# Altium project Light_SPT_Device_v1.0.PrjPcb (part 4 of 4)

## Sheet GPIOs_Relay_Rs232_Sheet.SchDoc
size 420 x 297 mm; SheetNumber: 5; SheetTotal: 5
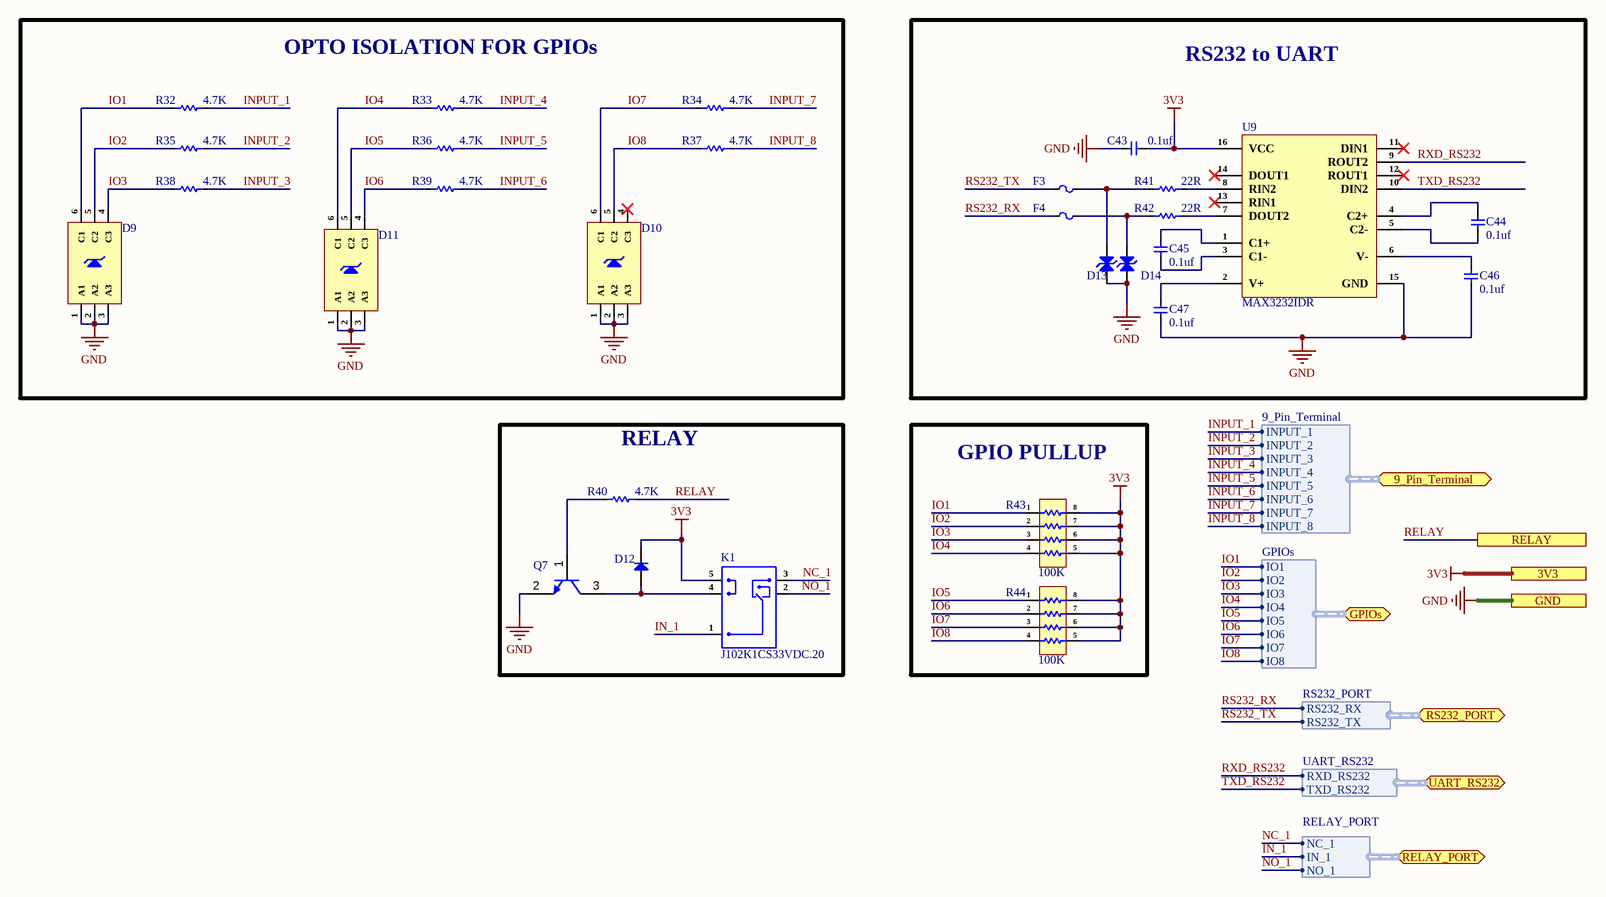
[diagram p4: GPIOs_Relay_Rs232_Sheet.SchDoc]

### Parts
C43  0.1uf  [Cap-0402]
C44  0.1uf  [Cap-0402]
C45  0.1uf  [Cap-0402]
C46  0.1uf  [Cap-0402]
C47  0.1uf  [Cap-0402]
D9  BZX84C3V3TS-7-F  [SOT-363]  (value not drawn)
D10  BZX84C3V3TS-7-F  [SOT-363]  (value not drawn)
D11  BZX84C3V3TS-7-F  [SOT-363]  (value not drawn)
D12  1N4148WS-7-F  [SOD-323]  (value not drawn)
D13  SMBJ26CA  [SMB_]  (value not drawn)
D14  SMBJ26CA  [SMB_]  (value not drawn)
F3  SMD0805P020TF  [Fuse-0805]  (value not drawn)
F4  SMD0805P020TF  [Fuse-0805]  (value not drawn)
K1  J102K1CS33VDC.20  [J102K1CS33VDC.20]
Q7  MMBT2222A-7-F  [SOT-23]  (value not drawn)
R32  4.7K  [Res-0402]
R33  4.7K  [Res-0402]
R34  4.7K  [Res-0402]
R35  4.7K  [Res-0402]
R36  4.7K  [Res-0402]
R37  4.7K  [Res-0402]
R38  4.7K  [Res-0402]
R39  4.7K  [Res-0402]
R40  4.7K  [Res-0402]
R41  22R  [Res-0402]
R42  22R  [Res-0402]
R43  100K  [YC164-JR-070RL]
R44  100K  [YC164-JR-070RL]
U9  MAX3232IDR  [SOIC-16]

### Blocks framed on the sheet
OPTO ISOLATION FOR GPIOs: D9-D11 R32-R39
RS232 to UART: C43-C47 D13 D14 F3 F4 R41 R42 U9
RELAY: D12 K1 Q7 R40
GPIO PULLUP: R43 R44

### Ports
3V3, 9_Pin_Terminal (bidir, harness 9_Pin_Terminal), GND, GPIOs (bidir, harness GPIOs), RELAY, RELAY_PORT (bidir, harness RELAY_PORT), RS232_PORT (bidir, harness RS232_PORT), UART_RS232 (bidir, harness UART_RS232)

### Harnesses
GPIOs: IO1, IO4, IO7, IO2, IO5, IO8, IO3, IO6
RELAY_PORT: NC_1, NO_1, IN_1
9_Pin_Terminal: INPUT_1, INPUT_2, INPUT_3, INPUT_4, INPUT_5, INPUT_6, INPUT_7, INPUT_8
RS232_PORT: RS232_RX, RS232_TX
UART_RS232: RXD_RS232, TXD_RS232

### Nets
3V3: C43.1 D12.1(K) K1.5 R43.5 R43.6 R43.7 R43.8 R44.5 R44.6 R44.7 R44.8 U9.16(VCC) ; port 3V3
GND: C43.2 C46.2 C47.2 D9.1(A1) D9.2(A2) D9.3(A3) D10.1(A1) D10.2(A2) D10.3(A3) D11.1(A1) D11.2(A2) D11.3(A3) D13.1(A) D14.1(A) Q7.2(E) U9.15(GND) ; port GND
IN_1: K1.1 ; port RELAY_PORT.IN_1
INPUT_1: R32.1 ; port 9_Pin_Terminal.INPUT_1
INPUT_2: R35.1 ; port 9_Pin_Terminal.INPUT_2
INPUT_3: R38.1 ; port 9_Pin_Terminal.INPUT_3
INPUT_4: R33.1 ; port 9_Pin_Terminal.INPUT_4
INPUT_5: R36.1 ; port 9_Pin_Terminal.INPUT_5
INPUT_6: R39.1 ; port 9_Pin_Terminal.INPUT_6
INPUT_7: R34.1 ; port 9_Pin_Terminal.INPUT_7
INPUT_8: R37.1 ; port 9_Pin_Terminal.INPUT_8
IO1: D9.6(C1) R32.2 R43.1 ; port GPIOs.IO1
IO2: D9.5(C2) R35.2 R43.2 ; port GPIOs.IO2
IO3: D9.4(C3) R38.2 R43.3 ; port GPIOs.IO3
IO4: D11.6(C1) R33.2 R43.4 ; port GPIOs.IO4
IO5: D11.5(C2) R36.2 R44.1 ; port GPIOs.IO5
IO6: D11.4(C3) R39.2 R44.2 ; port GPIOs.IO6
IO7: D10.6(C1) R34.2 R44.3 ; port GPIOs.IO7
IO8: D10.5(C2) R37.2 R44.4 ; port GPIOs.IO8
NC_1: K1.3 ; port RELAY_PORT.NC_1
NO_1: K1.2 ; port RELAY_PORT.NO_1
RELAY: R40.1 ; port RELAY
RS232_RX: F4.1 ; port RS232_PORT.RS232_RX
RS232_TX: F3.1 ; port RS232_PORT.RS232_TX
RXD_RS232: U9.9(ROUT2) ; port UART_RS232.RXD_RS232
TXD_RS232: U9.10(DIN2) ; port UART_RS232.TXD_RS232
NetC44_1: C44.1 U9.4(C2+)
NetC44_2: C44.2 U9.5(C2-)
NetC45_1: C45.1 U9.1(C1+)
NetC45_2: C45.2 U9.3(C1-)
NetC46_1: C46.1 U9.6(V-)
NetC47_1: C47.1 U9.2(V+)
NetD12_2: D12.2(A) K1.4 Q7.3(C)
NetD13_2: D13.2(K) F3.2 R41.1
NetD14_2: D14.2(K) F4.2 R42.1
NetQ7_1: Q7.1(B) R40.2
NetR41_2: R41.2 U9.8(RIN2)
NetR42_2: R42.2 U9.7(DOUT2)

Not connected (* = marked no-connect by the designer): D10 4(C3)*; U9 11(DIN1)* 12(ROUT1)* 13(RIN1)* 14(DOUT1)*

### Notes on the sheet
- File:
- Title:
- Date:
- Page
- Num:
- Total:
- Drawn By: Huzaifa Ali

### Library data of the parts
C43-C47 = GRM155R62A104KE14D: CAP CER 0.1UF 100V X5R 0402; Manufacturer: Murata; Capacitance: 100nF; Tolerance: 10%; Item Type: Capacitor; Supplier 1: Arrow Electronics; Manufacturer Part Number: GRM155R62A104KE14D; RoHS: Yes; Category: Ceramic Capacitors; Stock 1: 870000; Pricing 1: 10000=0.00500, 20000=0.00410, 30000=0.00390, 50000=0.00370, 100000=0.00300 (USD); Mount: Surface Mount; Case/Package: 0402; Case Code (Metric): 1005; Case Code (Imperial): 0402; Weight: 0.000212oz; Min Operating Temperature: -55°C; Max Operating Temperature: 85°C; Packaging: Tape and Reel; Voltage Rating: 100V; Dielectric: X5R; Termination: SMD/SMT; Voltage Rating (DC): 100V; Package Quantity: 10000; Series: GRM; Length: 0.039inch; Width: 0.02inch; Height: 0.5mm; Thickness: 0.022inch; Reach SVHC Compliant: Yes; Lead Free: Lead Free; RoHS Compliant: Yes; ComponentLink1URL: http://www.farnell.com/datasheets/2079151.pdf?src-supplier=Farnell; ComponentLink1Description: http://www.farnell.com/datasheets/2079151.pdf?src-supplier=Farnell; ComponentLink2URL: http://www.mouser.com/ds/2/281/c02e-2905.pdf?src-supplier=Mouser; ComponentLink2Description: http://www.mouser.com/ds/2/281/c02e-2905.pdf?src-supplier=Mouser; ComponentLink3URL: http://www.farnell.com/datasheets/2079151.pdf?src-supplier=Element14; ComponentLink3Description: http://www.farnell.com/datasheets/2079151.pdf?src-supplier=Element14; ComponentLink4URL: http://search.murata.co.jp/Ceramy/image/img/A01X/G101/ENG/GRM155R62A104KE14-01.pdf?src-supplier=Digi-Key; ComponentLink4Description: http://search.murata.co.jp/Ceramy/image/img/A01X/G101/ENG/GRM155R62A104KE14-01.pdf?src-supplier=Digi-Key; ComponentLink5URL: http://www.farnell.com/datasheets/2079151.pdf?src-supplier=Newark; ComponentLink5Description: http://www.farnell.com/datasheets/2079151.pdf?src-supplier=Newark; Supplier Part Number 1: GRM155R62A104KE14D; LCSC Part Number: C162178
D9-D11 = BZX84C3V3TS-7-F: DIODE ZENER ARRAY 3.3V SOT363; Manufacturer: Diodes Incorporated; Manufacturer Part Number: BZX84C3V3TS-7-F; Package: SOT-363-6; LCSC Part Number: C5124989; Item Type: Diode; ComponentLink1Description: LCSC; ComponentLink1URL: https://www.lcsc.com/product-detail/Zener-Diodes_Diodes-Incorporated-BZX84C3V3TS-7-F_C5124989.html
D12 = 1N4148WS-7-F: DIODE GEN PURP 75V 150MA SOD323; Manufacturer: Diodes; Forward Current: 300mA; Reverse Recovery Time: 4ns; Element Configuration: Single; Forward Voltage: 1.25V; Max Reverse Current: 1uA; Peak Non-Repetitive Surge Current: 2A; Power Dissipation: 200mW; Polarity: Standard; Capacitance: 2pF; Supplier 1: Mouser; Manufacturer Part Number: 1N4148WS-7-F; RoHS: Yes; Category: Rectifier Diodes; Pricing 1: 1=0.19000, 10=0.17500, 50=0.17500, 100=0.09600, 500=0.05900, 1000=0.04000, 3000=0.03000, 9000=0.02600, 10000=0.02600, 24000=0.02300, 45000=0.01900 (USD); Mount: Surface Mount; Number of Pins: 2; Weight: 0.000173oz; Contact Plating: Tin,Matte; Min Operating Temperature: -65°C; Max Operating Temperature: 150°C; Max Repetitive Reverse Voltage (Vrrm): 75V; Max Forward Surge Current (Ifsm): 2A; Max Surge Current: 2A; Packaging: Tape and Reel; Recovery Time: 4ns; Package Quantity: 3000; Average Rectified Current: 150mA; Voltage Rating (DC): 75V; Power Rating: 200mW; Current Rating: 150mA; Output Current: 150mA; Voltage: 75V; Max Reverse Voltage (DC): 75V; Series: -; Reverse Recovery Time-Max: 4ns; Length: 1.8mm; Width: 1.4mm; Height: 1mm; Radiation Hardening: No; REACH SVHC: No SVHC; Lead Free: Lead Free; RoHS Compliant: Yes; ComponentLink1URL: https://datasheet.ciiva.com/1179/ds30097-1179355.pdf?src-supplier=Element14; ComponentLink1Description: https://datasheet.ciiva.com/1179/ds30097-1179355.pdf?src-supplier=Element14; ComponentLink2URL: https://datasheet.ciiva.com/8300/ds30097-8300396.pdf?src-supplier=Avnet; ComponentLink2Description: https://datasheet.ciiva.com/8300/ds30097-8300396.pdf?src-supplier=Avnet; ComponentLink3URL: https://datasheet.ciiva.com/16199/ds30097-16199061.pdf?src-supplier=Future+Electronics; ComponentLink3Description: https://datasheet.ciiva.com/16199/ds30097-16199061.pdf?src-supplier=Future+Electronics; ComponentLink4URL: https://datasheet.ciiva.com/911/ds30097-911742.pdf?src-supplier=Digi-Key; ComponentLink4Description: https://datasheet.ciiva.com/911/ds30097-911742.pdf?src-supplier=Digi-Key; ComponentLink5URL: https://datasheet.ciiva.com/911/ds30097-911743.pdf?src-supplier=Digi-Key; ComponentLink5Description: https://datasheet.ciiva.com/911/ds30097-911743.pdf?src-supplier=Digi-Key; ComponentLink6URL: https://datasheet.ciiva.com/911/ds30097-911741.pdf?src-supplier=Digi-Key; ComponentLink6Description: https://datasheet.ciiva.com/911/ds30097-911741.pdf?src-supplier=Digi-Key; Supplier Part Number 1: 621-1N4148WS-F; LCSC Part Number: C60580; Item Type: Diode
D13 D14 = SMBJ26CA: SMB(DO-214AA) TVS ROHS; Manufacturer: MSKSEMI; Item Type: Diode; Manufacturer Part Number: SMBJ26CA; Package: SMB(DO-214AA); LCSC Part Number: C5331111; ComponentLink1Description: LCSC; ComponentLink1URL: https://www.lcsc.com/product-detail/TVS_MSKSEMI-SMBJ26CA_C5331111.html
F3 F4 = SMD0805P020TF: 9V 200mA 100A 500mA 0805 Resettable Fuses ROHS; Manufacturer: RUILON; Item Type: Fuse; Manufacturer Part Number: SMD0805P020TF; Package: 0805; LCSC Part Number: C20976; ComponentLink1Description: LCSC; ComponentLink1URL: https://www.lcsc.com/product-detail/Resettable-Fuses_RUILON-Shenzhen-Ruilongyuan-Elec-SMD0805P020TF_C20976.html
K1 = J102K1CS33VDC.20: RELAY GEN PURPOSE SPDT 3A 3V; Manufacturer: CIT Relay & Switch; Supplier: Digi-Key; Supplier Part Number: 2449-J102K1CS33VDC.20-ND; Manufacturer Part Number: J102K1CS33VDC.20; RoHS: No; Category: Power Relays; Stock: 9880; Pricing: 1=1.6, 10=1.5, 25=1.3332, 50=1.2666, 100=1.1999, 250=1.06656, 500=0.9999, 1000=0.93324, 5000=0.89991 (USD); Item Type: Relay
Q7 = MMBT2222A-7-F: TRANS NPN 40V 0.6A SMD SOT23-3; Manufacturer: Diodes; Max Power Dissipation: 300mW; Collector Base Voltage (VCBO): 75V; Max Collector Current: 600mA; hFE Min: 100; Frequency: 300MHz; Number of Elements: 1; Emitter Base Voltage (VEBO): 6V; Collector Emitter Saturation Voltage: 1V; Power Dissipation: 350mW; Element Configuration: Single; Current: 1A; Item Type: Mosfet; Supplier 1: Digi-Key; Manufacturer Part Number: MMBT2222A-7-F; Stock 1: 2471182; Pricing 1: 1=0.15, 10=0.134, 100=0.0729, 500=0.04486, 1000=0.03059 (USD); Mount: Surface Mount; Case/Package: SOT-23; Number of Pins: 3; Weight: 0.000282oz; Contact Plating: Matte,Tin; Min Operating Temperature: -55°C; Max Operating Temperature: 150°C; Packaging: Tape and Reel; Collector Emitter Voltage (VCEO): 40V; Polarity: NPN; Voltage Rating (DC): 40V; Package Quantity: 3000; Continuous Collector Current: 600mA; Collector Emitter Breakdown Voltage: 40V; Transition Frequency: 300MHz; Max Breakdown Voltage: 40V; Max Frequency: 300MHz; Termination: SMD/SMT; Gain Bandwidth Product: 300MHz; Current Rating: 600mA; Voltage: 40V; Length: 3.05mm; Height: 1mm; Width: 1.4mm; Radiation Hardening: No; Lead Free: Lead Free; REACH SVHC: No SVHC; ComponentLink1URL: http://www.diodes.com/datasheets/ds30041.pdf?src-supplier=Future+Electronics; ComponentLink1Description: http://www.diodes.com/datasheets/ds30041.pdf?src-supplier=Future+Electronics; ComponentLink2URL: http://www.diodes.com/datasheets/ds30041.pdf?src-supplier=Avnet; ComponentLink2Description: http://www.diodes.com/datasheets/ds30041.pdf?src-supplier=Avnet; ComponentLink3URL: https://www.verical.com/server-webapp/html/getDatasheet?partID=82692&src-supplier=Verical; ComponentLink3Description: https://www.verical.com/server-webapp/html/getDatasheet?partID=82692&src-supplier=Verical; ComponentLink4URL: https://www.diodes.com/assets/Datasheets/ds30041.pdf?src-supplier=Digi-Key; ComponentLink4Description: https://www.diodes.com/assets/Datasheets/ds30041.pdf?src-supplier=Digi-Key; ComponentLink5URL: http://www.diodes.com/datasheets/ds30041.pdf?src-supplier=Avnet+Europe; ComponentLink5Description: http://www.diodes.com/datasheets/ds30041.pdf?src-supplier=Avnet+Europe; ComponentLink6URL: http://www.diodes.com/datasheets/ds30041.pdf?src-supplier=Element14; ComponentLink6Description: http://www.diodes.com/datasheets/ds30041.pdf?src-supplier=Element14; Supplier Part Number 1: MMBT2222A-FDIDKR-ND; LCSC Part Number: C94515
R32-R40 = RC0402FR-074K7L: RES 4.7K OHM 1% 1/16W 0402; Manufacturer: Yageo; Voltage Rating (DC): 50V; Power Rating: 62.5mW; Resistance: 4.7kR; Temperature Coefficient: 100ppm/°C; Max Power Dissipation: 63mW; Item Type: Resistor; Supplier 1: Avnet; Manufacturer Part Number: RC0402FR-074K7L; RoHS: Yes; Category: Chip SMD Resistors; Stock 1: 2420000; Pricing 1: 10000=0.00085 (USD); Case/Package: 0402; Number of Pins: 2; Case Code (Imperial): 0402; Case Code (Metric): 1005; Size Code: 0402; Min Operating Temperature: -55°C; Max Operating Temperature: 155°C; Tolerance: 1%; Voltage Rating: 50V; Packaging: Tape and Reel; Resistor Type: Thick Film; Termination: SMD/SMT; Features: Moisture Resistant; Series: RC; Number of Terminations: 2; Resistance Tolerance: 1%; Construction: Rectangular; Length: 1mm; Width: 0.5mm; Height: 0.32mm; Depth: 0.5mm; Height - Seated (Max): 0.016inch; RoHS Compliant: Yes; Reach SVHC Compliant: Yes; Military Standard: Not; Lead Free: Lead Free; ComponentLink1URL: https://datasheet.ciiva.com/22661/1686128-22661342.pdf?src-supplier=Element14; ComponentLink1Description: https://datasheet.ciiva.com/22661/1686128-22661342.pdf?src-supplier=Element14; ComponentLink2URL: https://datasheet.ciiva.com/7850/1018594-7850022.pdf?src-supplier=Element14; ComponentLink2Description: https://datasheet.ciiva.com/7850/1018594-7850022.pdf?src-supplier=Element14; ComponentLink3URL: https://datasheet.ciiva.com/7850/1018594-7850023.pdf?src-supplier=Element14; ComponentLink3Description: https://datasheet.ciiva.com/7850/1018594-7850023.pdf?src-supplier=Element14; ComponentLink4URL: https://datasheet.ciiva.com/15215/getdatasheetpartid-328119-15215035.pdf?src-supplier=Verical; ComponentLink4Description: https://datasheet.ciiva.com/15215/getdatasheetpartid-328119-15215035.pdf?src-supplier=Verical; Supplier Part Number 1: RC0402FR-074K7L; LCSC Part Number: C105871
R41 R42 = RCS040222R0FKED: RES SMD 22 OHM 1% 1/5W 0402; Manufacturer: Vishay Dale; Max Power Dissipation: 200mW; Temperature Coefficient: 100ppm/°C; Supplier 1: Digi-Key; Manufacturer Part Number: RCS040222R0FKED; Stock 1: 8456; Pricing 1: 1=0.12, 10=0.105, 100=0.0402, 1000=0.01771, 2500=0.0153, 5000=0.01368 (USD); Case/Package: 0402; Case Code (Metric): 1005; Case Code (Imperial): 0402; Min Operating Temperature: -55°C; Max Operating Temperature: 155°C; Packaging: Tape and Reel; Resistance: 22R; Resistor Type: Thick Film; Number of Terminations: 2; Tolerance: 1%; Features: Automotive AEC-Q200; Length: 0.039inch; Width: 0.02inch; Height: 0.016inch; RoHS Compliant: Yes; ComponentLink1URL: http://www.vishay.com/docs/20065/rcse3.pdf?src-supplier=Digi-Key; ComponentLink1Description: http://www.vishay.com/docs/20065/rcse3.pdf?src-supplier=Digi-Key; Supplier Part Number 1: 541-2880-1-ND; LCSC Part Number: C2086081
R43 R44 = YC164-JR-07100KL: RES ARRAY 4 RES 100K OHM 1206; Manufacturer: Yageo; Item Type: Resistor; Supplier: Future Electronics; Supplier Part Number: 4734737; Manufacturer Part Number: YC164-JR-07100KL; RoHS: Yes; Category: Resistor Arrays; Stock: 10000; Pricing: 5000=0.0086, 20000=0.0082, 50000=0.0078, 100000=0.0078, 125000=0.0075, 200000=0.0076, 625000=0.0071 (USD); ComponentLink1URL: https://datasheet.ciiva.com/11807/0900766b80c69e1d-11807026.pdf?src-supplier=Rs; ComponentLink1Description: https://datasheet.ciiva.com/11807/0900766b80c69e1d-11807026.pdf?src-supplier=Rs; ComponentLink2URL: https://datasheet.ciiva.com/8017/443424-8017993.pdf?src-supplier=Element14; ComponentLink2Description: https://datasheet.ciiva.com/8017/443424-8017993.pdf?src-supplier=Element14; ComponentLink3URL: https://datasheet.ciiva.com/8017/443424-8017994.pdf?src-supplier=Element14; ComponentLink3Description: https://datasheet.ciiva.com/8017/443424-8017994.pdf?src-supplier=Element14; ComponentLink4URL: https://datasheet.ciiva.com/17478/pyu-yc-tc164-51-rohs-l-3-17478885.pdf?src-supplier=Future+Electronics; ComponentLink4Description: https://datasheet.ciiva.com/17478/pyu-yc-tc164-51-rohs-l-3-17478885.pdf?src-supplier=Future+Electronics; ComponentLink5URL: https://datasheet.ciiva.com/2693/pyu-yc-tc164-51-rohs-l-3-2693249.pdf?src-supplier=Digi-Key; ComponentLink5Description: https://datasheet.ciiva.com/2693/pyu-yc-tc164-51-rohs-l-3-2693249.pdf?src-supplier=Digi-Key; ComponentLink6URL: https://datasheet.ciiva.com/2693/pyu-yc-tc164-51-rohs-l-3-2693250.pdf?src-supplier=Digi-Key; ComponentLink6Description: https://datasheet.ciiva.com/2693/pyu-yc-tc164-51-rohs-l-3-2693250.pdf?src-supplier=Digi-Key; ComponentLink7URL: https://datasheet.ciiva.com/2693/pyu-yc-tc164-51-rohs-l-3-2693251.pdf?src-supplier=Digi-Key; ComponentLink7Description: https://datasheet.ciiva.com/2693/pyu-yc-tc164-51-rohs-l-3-2693251.pdf?src-supplier=Digi-Key; LCSC Part Number: C192933
U9 = MAX3232IDR: IC TRANSCEIVER FULL 2/2 16SOIC; Manufacturer: Texas Instruments; Min Supply Voltage: 3V; Max Supply Voltage: 5.5V; Data Rate: 250Kbps; Number of Receivers: 2; Operating Supply Voltage: 5V; Logic Function: Transceiver,Receiver; Number of Transceivers: 1; Supply Current: 1mA; Simplex/Duplex: Full Duplex; Receiver Hysteresis: 300mV; Supplier 1: Mouser; Manufacturer Part Number: MAX3232IDR; RoHS: Yes; Category: Interface ICs; Stock 1: 22181; Pricing 1: 1=2.37, 10=2.37, 50=2.37, 100=2.37, 1000=2.37, 10000=2.37 (USD); Mounting Technology: Surface Mount; Case/Package: D; Pins: 16; Weight: 0.004998oz; Min Operating Temperature: -40°C; Max Operating Temperature: 85°C; Packaging: Tape and Reel; Package Quantity: 1; Number of Transmitters: 2; Number of Drivers: 2; Series: -; Operating Supply Current: 1mA; Lead Free: Lead Free; RoHS Compliant: Yes; Reach SVHC Compliant: No; ComponentLink1URL: https://datasheet.ciiva.com/8064/1882754-8064745.pdf?src-supplier=Element14; ComponentLink1Description: https://datasheet.ciiva.com/8064/1882754-8064745.pdf?src-supplier=Element14; ComponentLink2URL: https://datasheet.ciiva.com/46394/1882754-46394523.pdf?src-supplier=Element14; ComponentLink2Description: https://datasheet.ciiva.com/46394/1882754-46394523.pdf?src-supplier=Element14; ComponentLink3URL: https://datasheet.ciiva.com/46397/1882754-46397996.pdf?src-supplier=Element14; ComponentLink3Description: https://datasheet.ciiva.com/46397/1882754-46397996.pdf?src-supplier=Element14; ComponentLink4URL: https://datasheet.ciiva.com/1701/max3232-1701626.pdf?src-supplier=Digi-Key; ComponentLink4Description: https://datasheet.ciiva.com/1701/max3232-1701626.pdf?src-supplier=Digi-Key; ComponentLink5URL: https://datasheet.ciiva.com/1701/max3232-1701625.pdf?src-supplier=Digi-Key; ComponentLink5Description: https://datasheet.ciiva.com/1701/max3232-1701625.pdf?src-supplier=Digi-Key; ComponentLink6URL: https://datasheet.ciiva.com/1701/max3232-1701627.pdf?src-supplier=Digi-Key; ComponentLink6Description: https://datasheet.ciiva.com/1701/max3232-1701627.pdf?src-supplier=Digi-Key; Supplier Part Number 1: 595-MAX3232IDR; LCSC Part Number: C18261; Item Type: IC

## Nets that join several sheets
3V3: Power_Sheet (6 pins), Controller_Sheet (24 pins), GSM_Sheet (C42.1 U8.7), GPIOs_Relay_Rs232_Sheet (12 pins)
3V9: Power_Sheet (7 pins), Controller_Sheet (J7.1), GSM_Sheet (5 pins)
GND: Power_Sheet (18 pins), Controller_Sheet (33 pins), GSM_Sheet (60 pins), GPIOs_Relay_Rs232_Sheet (16 pins)
VCC: Power_Sheet (11 pins), Controller_Sheet (D2.1)
GSM_BUCK_EN: Controller_Sheet (U4.14), GSM_Sheet (R16.2)
GSM_PWR_EN: Controller_Sheet (U4.12), GSM_Sheet (R30.2)
GSM_RST: Controller_Sheet (U4.13), GSM_Sheet (R28.2)
IN_1: Power_Sheet (J5.2), GPIOs_Relay_Rs232_Sheet (K1.1)
INPUT_1: Power_Sheet (J3.1), GPIOs_Relay_Rs232_Sheet (R32.1)
INPUT_2: Power_Sheet (J3.2), GPIOs_Relay_Rs232_Sheet (R35.1)
INPUT_3: Power_Sheet (J3.3), GPIOs_Relay_Rs232_Sheet (R38.1)
INPUT_4: Power_Sheet (J4.1), GPIOs_Relay_Rs232_Sheet (R33.1)
INPUT_5: Power_Sheet (J4.2), GPIOs_Relay_Rs232_Sheet (R36.1)
INPUT_6: Power_Sheet (J4.3), GPIOs_Relay_Rs232_Sheet (R39.1)
INPUT_7: Power_Sheet (J6.1), GPIOs_Relay_Rs232_Sheet (R34.1)
INPUT_8: Power_Sheet (J6.2), GPIOs_Relay_Rs232_Sheet (R37.1)
IO1: Controller_Sheet (U4.15), GPIOs_Relay_Rs232_Sheet (D9.6 R32.2 R43.1)
IO2: Controller_Sheet (U4.16), GPIOs_Relay_Rs232_Sheet (D9.5 R35.2 R43.2)
IO3: Controller_Sheet (U4.17), GPIOs_Relay_Rs232_Sheet (D9.4 R38.2 R43.3)
IO4: Controller_Sheet (U4.18), GPIOs_Relay_Rs232_Sheet (D11.6 R33.2 R43.4)
IO5: Controller_Sheet (U4.19), GPIOs_Relay_Rs232_Sheet (D11.5 R36.2 R44.1)
IO6: Controller_Sheet (U4.21), GPIOs_Relay_Rs232_Sheet (D11.4 R39.2 R44.2)
IO7: Controller_Sheet (U4.22), GPIOs_Relay_Rs232_Sheet (D10.6 R34.2 R44.3)
IO8: Controller_Sheet (U4.27), GPIOs_Relay_Rs232_Sheet (D10.5 R37.2 R44.4)
MCU_RX: Controller_Sheet (U4.10), GSM_Sheet (U8.8)
MCU_TX: Controller_Sheet (U4.11), GSM_Sheet (U8.1)
NC_1: Power_Sheet (J5.1), GPIOs_Relay_Rs232_Sheet (K1.3)
NO_1: Power_Sheet (J5.3), GPIOs_Relay_Rs232_Sheet (K1.2)
RELAY: Controller_Sheet (U4.43), GPIOs_Relay_Rs232_Sheet (R40.1)
RS232_RX: Power_Sheet (J2.1), GPIOs_Relay_Rs232_Sheet (F4.1)
RS232_TX: Power_Sheet (J2.2), GPIOs_Relay_Rs232_Sheet (F3.1)
RXD_RS232: Controller_Sheet (U4.23), GPIOs_Relay_Rs232_Sheet (U9.9)
TXD_RS232: Controller_Sheet (U4.24), GPIOs_Relay_Rs232_Sheet (U9.10)